# Altium schematic sheet Speaker_Sec.SchDoc
size A4
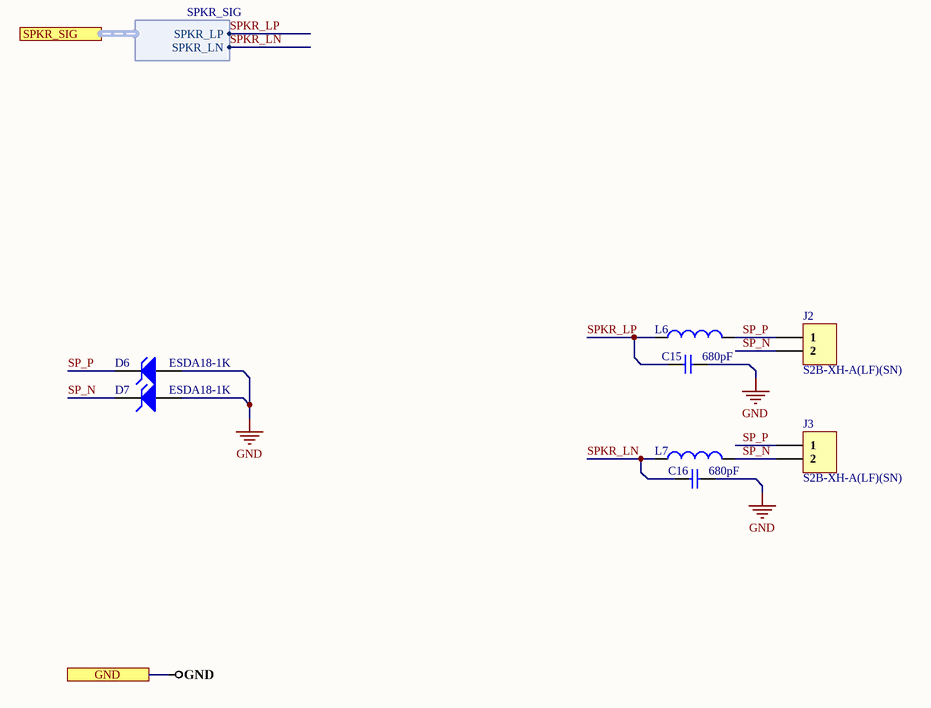
[diagram p0: Speaker_Sec.SchDoc]

## Parts
C15  680pF  [CAP 0201]
C16  680pF  [CAP 0201]
D6  ESDA18-1K  [SOD-523]
D7  ESDA18-1K  [SOD-523]
J2  S2B-XH-A(LF)(SN)  [S2B-XH-A(LF)(SN)]
J3  S2B-XH-A(LF)(SN)  [S2B-XH-A(LF)(SN)]
L6  BLM15AG121SN1D  [BLM15AG121SN1D]  (value not drawn)
L7  BLM15AG121SN1D  [BLM15AG121SN1D]  (value not drawn)

## Ports
GND, SPKR_SIG (harness SPKR_SIG)

## Harnesses
SPKR_SIG: SPKR_LP, SPKR_LN

## Nets
GND: C15.2 C16.2 D6.2(A) D7.2(A) ; port GND
SP_N: D7.1(K) J2.2 J3.2 L7.2
SP_P: D6.1(K) J2.1 J3.1 L6.2
SPKR_LN: C16.1 L7.1 ; port SPKR_SIG.SPKR_LN
SPKR_LP: C15.1 L6.1 ; port SPKR_SIG.SPKR_LP

## Library data of the parts
C15 C16 = GRM033R71H681MA12D: CAP CER 680PF 50V X7R 0201; Manufacturer: Murata; Tolerance: 20%; Supplier 1: Digi-Key; Manufacturer Part Number: GRM033R71H681MA12D; RoHS: Yes; Category: Ceramic Capacitors; Stock 1: 2794; Pricing 1: 1=0.10000, 10=0.02500, 50=0.01380, 100=0.01130, 500=0.00808, 1000=0.00635, 2500=0.00578, 5000=0.00531 (USD); Mount: Surface Mount; Case/Package: 0201; Case Code (Imperial): 0201; Case Code (Metric): 0603; Weight: 1.2E-05oz; Min Operating Temperature: -55°C; Max Operating Temperature: 125°C; Capacitance: 680pF; Packaging: Tape and Reel; Voltage Rating: 50V; Dielectric: X7R; Termination: SMD/SMT; Resistor Type: Ceramic; Voltage Rating (DC): 50V; Package Quantity: 15000; Length: 0.024inch; Width: 0.3mm; Height: 0.3mm; Thickness: 0.013inch; RoHS Compliant: Yes; ComponentLink1URL: http://www.mouser.com/ds/2/281/c02e-2905.pdf?src-supplier=Mouser; ComponentLink1Description: http://www.mouser.com/ds/2/281/c02e-2905.pdf?src-supplier=Mouser; ComponentLink2URL: http://search.murata.co.jp/Ceramy/image/img/A01X/G101/ENG/GRM033R71H681MA12-01.pdf?src-supplier=Digi-Key; ComponentLink2Description: http://search.murata.co.jp/Ceramy/image/img/A01X/G101/ENG/GRM033R71H681MA12-01.pdf?src-supplier=Digi-Key; ComponentLink3URL: https://search.murata.co.jp/Ceramy/image/img/A01X/G101/ENG/GRM033R71H681MA12-01.pdf?src-supplier=Digi-Key; ComponentLink3Description: https://search.murata.co.jp/Ceramy/image/img/A01X/G101/ENG/GRM033R71H681MA12-01.pdf?src-supplier=Digi-Key; Supplier Part Number 1: 490-16749-1-ND
D6 D7 = ESDA18-1K: TVS DIODE 15V 34V SOD523; Manufacturer: STMicroelectronics; Direction: Unidirectional; Number of Unidirectional Channels: 1; Min Breakdown Voltage: 18V; Peak Pulse Power: 400W; Power Line Protection: No; Max Power Dissipation: 450W; Peak Pulse Current: 12A; Diode Type: ZENER; Capacitance: 105pF; Leakage Current: 500nA; Element Configuration: Single; ESD Protection: Yes; Clamping Voltage-Max: 24V; Supplier 1: Digi-Key; Manufacturer Part Number: ESDA18-1K; RoHS: Yes; Category: TVS Diodes; Stock 1: 43962; Pricing 1: 1=0.41000, 10=0.28900, 100=0.14570, 500=0.12912, 1000=0.10049 (USD); Mount: Surface Mount; Number of Pins: 2; Contact Plating: Tin,Matte; Min Operating Temperature: -40°C; Max Operating Temperature: 150°C; Clamping Voltage: 34V; Packaging: Tape and Reel; Package Quantity: 1; Reverse Standoff Voltage: 15V; Polarity: Unidirectional; Breakdown Voltage: 18V; Working Voltage: 15V; Resistor Type: Zener; Series: ESDA, TRANSIL™; Number of Channels: 1; Termination: SMD/SMT; Max Reverse Leakage Current: 500nA; Max Breakdown Voltage: 18V; Length: 1.2mm; Width: 0.9mm; Height: 0.5mm; Depth: 0.8mm; Radiation Hardening: No; RoHS Compliant: Yes; REACH SVHC: No SVHC; Lead Free: Lead Free; ComponentLink1URL: https://datasheet.ciiva.com/25958/cd00283838-25958148.pdf?src-supplier=Avnet+Europe; ComponentLink1Description: https://datasheet.ciiva.com/25958/cd00283838-25958148.pdf?src-supplier=Avnet+Europe; ComponentLink2URL: https://datasheet.ciiva.com/1276/1303462-1276854.pdf?src-supplier=Element14; ComponentLink2Description: https://datasheet.ciiva.com/1276/1303462-1276854.pdf?src-supplier=Element14; ComponentLink3URL: https://datasheet.ciiva.com/4479/cd00283838-118092-4479548.pdf?src-supplier=Mouser; ComponentLink3Description: https://datasheet.ciiva.com/4479/cd00283838-118092-4479548.pdf?src-supplier=Mouser; ComponentLink4URL: https://datasheet.ciiva.com/5782/cd00283838-5782837.pdf?src-supplier=Farnell; ComponentLink4Description: https://datasheet.ciiva.com/5782/cd00283838-5782837.pdf?src-supplier=Farnell; ComponentLink5URL: https://datasheet.ciiva.com/337/cd00283838-337816.pdf?src-supplier=Digi-Key; ComponentLink5Description: https://datasheet.ciiva.com/337/cd00283838-337816.pdf?src-supplier=Digi-Key; ComponentLink6URL: https://datasheet.ciiva.com/16437/cd00283838-16437848.pdf?src-supplier=Future+Electronics; ComponentLink6Description: https://datasheet.ciiva.com/16437/cd00283838-16437848.pdf?src-supplier=Future+Electronics; ComponentLink7URL: https://datasheet.ciiva.com/337/cd00283838-337817.pdf?src-supplier=Digi-Key; ComponentLink7Description: https://datasheet.ciiva.com/337/cd00283838-337817.pdf?src-supplier=Digi-Key; ComponentLink8URL: https://datasheet.ciiva.com/337/cd00283838-337818.pdf?src-supplier=Digi-Key; ComponentLink8Description: https://datasheet.ciiva.com/337/cd00283838-337818.pdf?src-supplier=Digi-Key; ComponentLink9URL: https://datasheet.ciiva.com/11195/cd00283838-11195357.pdf?src-supplier=Avnet; ComponentLink9Description: https://datasheet.ciiva.com/11195/cd00283838-11195357.pdf?src-supplier=Avnet; ComponentLink10URL: https://datasheet.ciiva.com/15193/getdatasheetpartid-249500-15193085.pdf?src-supplier=Verical; ComponentLink10Description: https://datasheet.ciiva.com/15193/getdatasheetpartid-249500-15193085.pdf?src-supplier=Verical; Supplier Part Number 1: 497-10767-1-ND
J2 J3 = S2B-XH-A(LF)(SN): CONN HEADER R/A 2POS 2.5MM; Manufacturer: JST; Current Rating: 3A; Contact Resistance: 20mR; Voltage Rating (AC): 250V; Number of Positions: 2; Insulation Resistance: 1GR; Gender: Male; Connector Type: Male Pin; Wire/Cable Gauge: 22AWG; Supplier 1: Digi-Key; Manufacturer Part Number: S2B-XH-A(LF)(SN); RoHS: Yes; Category: Headers and Wire Housings; Stock 1: 44898; Pricing 1: 1=0.17000, 10=0.16200, 100=0.11260, 500=0.09524, 1000=0.07792, 5000=0.06927, 10000=0.06277 (USD); Mount: Through Hole; Contact Material: Brass; Contact Plating: Tin,Copper,Lead; Color: Natural; Housing Color: White; Housing Material: Polyamide; Min Operating Temperature: -25°C; Max Operating Temperature: 85°C; Number of Rows: 1; Voltage Rating: 250V; Termination: Press-Fit; Number of Contacts: 2; Max Current Rating: 3A; Package Quantity: 1000; Packaging: Bulk; Max Voltage Rating (AC): 250V; Max Voltage Rating (DC): 250V; Orientation: Right Angle; Length: 7.4mm; Pitch: 2.5mm; Lead Pitch: 2.5mm; Depth: 11.5mm; REACH SVHC: No SVHC; Lead Free: Lead Free; ComponentLink1URL: https://datasheet.ciiva.com/16208/s2b-xh-alfsn-16208978.pdf?src-supplier=Future+Electronics; ComponentLink1Description: https://datasheet.ciiva.com/16208/s2b-xh-alfsn-16208978.pdf?src-supplier=Future+Electronics; ComponentLink2URL: https://datasheet.ciiva.com/8052/1684882-8052211.pdf?src-supplier=Element14; ComponentLink2Description: https://datasheet.ciiva.com/8052/1684882-8052211.pdf?src-supplier=Element14; ComponentLink3URL: https://datasheet.ciiva.com/11746/0900766b8082f560-11746947.pdf?src-supplier=RSComponents; ComponentLink3Description: https://datasheet.ciiva.com/11746/0900766b8082f560-11746947.pdf?src-supplier=RSComponents; ComponentLink4URL: https://datasheet.ciiva.com/26894/getdatasheetpartid-640270-26894603.pdf?src-supplier=Verical; ComponentLink4Description: https://datasheet.ciiva.com/26894/getdatasheetpartid-640270-26894603.pdf?src-supplier=Verical; ComponentLink5URL: https://datasheet.ciiva.com/26924/getdatasheetpartid-645395-26924076.pdf?src-supplier=Verical; ComponentLink5Description: https://datasheet.ciiva.com/26924/getdatasheetpartid-645395-26924076.pdf?src-supplier=Verical; ComponentLink6URL: https://datasheet.ciiva.com/26894/getdatasheetpartid-441330-26894909.pdf?src-supplier=Verical; ComponentLink6Description: https://datasheet.ciiva.com/26894/getdatasheetpartid-441330-26894909.pdf?src-supplier=Verical; ComponentLink7URL: https://datasheet.ciiva.com/726/exh-726412.pdf?src-supplier=Digi-Key; ComponentLink7Description: https://datasheet.ciiva.com/726/exh-726412.pdf?src-supplier=Digi-Key; ComponentLink8URL: https://datasheet.ciiva.com/20207/523653-20207183.pdf?src-supplier=Rapid+Electronics; ComponentLink8Description: https://datasheet.ciiva.com/20207/523653-20207183.pdf?src-supplier=Rapid+Electronics; Supplier Part Number 1: 455-2257-ND
L6 L7 = BLM15AG121SN1D: FERRITE BEAD 120 OHM 0402 1LN; Manufacturer: Murata; Material: Steel,Ferrite; Impedance: 120R; Tolerance: 25%; Max DC Current: 500mA; DC Resistance (DCR): 190mR; Current Rating: 550mA; Test Frequency: 100MHz; Number of Lines: 1; Shielding: Unshielded; Supplier 1: Digi-Key; Manufacturer Part Number: BLM15AG121SN1D; RoHS: Yes; Category: Ferrite Beads and Chips; Stock 1: 397712; Pricing 1: 1=0.10000, 10=0.07400, 25=0.06720, 50=0.06040, 100=0.04430, 250=0.03220, 500=0.02950, 1000=0.02548, 5000=0.02012 (USD); Case/Package: 0402; Number of Pins: 2; Core Material: Ferrite; Case Code (Metric): 1005; Case Code (Imperial): 0402; Min Operating Temperature: -55°C; Max Operating Temperature: 125°C; Package Quantity: 1; Packaging: Tape and Reel; Max Current Rating: 550mA; Termination: SMD/SMT; DC Current: 500mA; Frequency: 100MHz; Number of Circuits: 1; Length: 1mm; Width: 0.5mm; Height: 0.5mm; Depth: 0.55mm; Radiation Hardening: No; REACH SVHC: No SVHC; Military Standard: Not; Lead Free: Lead Free; RoHS Compliant: Yes; ComponentLink1URL: https://datasheet.ciiva.com/18090/getdatasheetpartid-210548-18090179.pdf?src-supplier=Verical; ComponentLink1Description: https://datasheet.ciiva.com/18090/getdatasheetpartid-210548-18090179.pdf?src-supplier=Verical; ComponentLink2URL: https://datasheet.ciiva.com/11800/0900766b811b5866-11800861.pdf?src-supplier=RSComponents; ComponentLink2Description: https://datasheet.ciiva.com/11800/0900766b811b5866-11800861.pdf?src-supplier=RSComponents; ComponentLink3URL: https://datasheet.ciiva.com/34302/1844660-34302798.pdf?src-supplier=Jameco; ComponentLink3Description: https://datasheet.ciiva.com/34302/1844660-34302798.pdf?src-supplier=Jameco; ComponentLink4URL: https://datasheet.ciiva.com/29347/442175-da-01-en-chip-drossel-0402-120r-500ma-1-0x0-5mm-29347874.pdf?src-supplier=Conrad; ComponentLink4Description: https://datasheet.ciiva.com/29347/442175-da-01-en-chip-drossel-0402-120r-500ma-1-0x0-5mm-29347874.pdf?src-supplier=Conrad; ComponentLink5URL: https://datasheet.ciiva.com/41449/001172160-da-01-en-drossel-0402-120r-1-0x0-5mm-10000st-41449449.pdf?src-supplier=Conrad; ComponentLink5Description: https://datasheet.ciiva.com/41449/001172160-da-01-en-drossel-0402-120r-1-0x0-5mm-10000st-41449449.pdf?src-supplier=Conrad; ComponentLink6URL: https://datasheet.ciiva.com/1466/5144-1466740.pdf?src-supplier=Element14; ComponentLink6Description: https://datasheet.ciiva.com/1466/5144-1466740.pdf?src-supplier=Element14; ComponentLink7URL: https://datasheet.ciiva.com/1466/5144-1466741.pdf?src-supplier=Element14; ComponentLink7Description: https://datasheet.ciiva.com/1466/5144-1466741.pdf?src-supplier=Element14; ComponentLink8URL: https://datasheet.ciiva.com/6212/l0110s0100blm15ag-sn-6212533.pdf?src-supplier=Digi-Key; ComponentLink8Description: https://datasheet.ciiva.com/6212/l0110s0100blm15ag-sn-6212533.pdf?src-supplier=Digi-Key; ComponentLink9URL: https://datasheet.ciiva.com/17279/l0110s0100blm15ag-sn-17279627.pdf?src-supplier=Avnet+Europe; ComponentLink9Description: https://datasheet.ciiva.com/17279/l0110s0100blm15ag-sn-17279627.pdf?src-supplier=Avnet+Europe; ComponentLink10URL: https://datasheet.ciiva.com/3081/l0110s0100blm15ag-sn-3081598.pdf?src-supplier=Avnet; ComponentLink10Description: https://datasheet.ciiva.com/3081/l0110s0100blm15ag-sn-3081598.pdf?src-supplier=Avnet; ComponentLink11URL: https://datasheet.ciiva.com/3081/l0110s0100blm15ag-sn-3081599.pdf?src-supplier=Avnet; ComponentLink11Description: https://datasheet.ciiva.com/3081/l0110s0100blm15ag-sn-3081599.pdf?src-supplier=Avnet; ComponentLink12URL: https://datasheet.ciiva.com/6212/l0110s0100blm15ag-sn-6212527.pdf?src-supplier=Digi-Key; ComponentLink12Description: https://datasheet.ciiva.com/6212/l0110s0100blm15ag-sn-6212527.pdf?src-supplier=Digi-Key; ComponentLink13URL: https://datasheet.ciiva.com/14122/blm-series-eng-tds-14122927.pdf?src-supplier=Distrelec; ComponentLink13Description: https://datasheet.ciiva.com/14122/blm-series-eng-tds-14122927.pdf?src-supplier=Distrelec; Supplier Part Number 1: 490-1005-1-ND